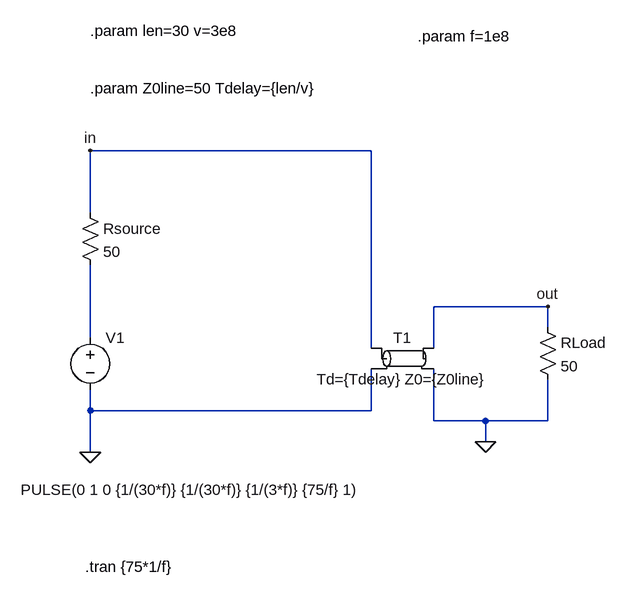
[diagram p0: schematic modelLinieFP_timp.asc]
modelLinieFP_timp.asc, the LTspice schematic file:
Version 4
SHEET 1 1040 1048
WIRE -352 320 -784 320
WIRE -784 416 -784 320
WIRE -80 560 -256 560
WIRE -80 592 -80 560
WIRE -784 608 -784 496
WIRE -352 624 -352 320
WIRE -256 624 -256 560
WIRE -784 720 -784 688
WIRE -352 720 -352 656
WIRE -352 720 -784 720
WIRE -256 736 -256 656
WIRE -176 736 -256 736
WIRE -80 736 -80 672
WIRE -80 736 -176 736
WIRE -176 768 -176 736
WIRE -784 784 -784 720
FLAG -784 784 0
FLAG -176 768 0
FLAG -80 560 out
FLAG -784 320 in
SYMBOL res -96 576 R0
SYMATTR InstName RLoad
SYMATTR Value 50
SYMBOL tline -304 640 R0
SYMATTR InstName T1
SYMATTR Value Td={Tdelay} Z0={Z0line}
SYMBOL voltage -784 592 R0
WINDOW 123 24 124 Left 2
WINDOW 39 24 44 Left 2
WINDOW 3 -107 250 Left 2
SYMATTR Value PULSE(0 1 0 {1/(30*f)} {1/(30*f)} {1/(3*f)} {75/f} 1)
SYMATTR InstName V1
SYMBOL res -800 400 R0
SYMATTR InstName Rsource
SYMATTR Value 50
TEXT -792 960 Left 2 !.tran {75*1/f}
TEXT -784 136 Left 2 !.param len=30 v=3e8
TEXT -784 224 Left 2 !.param Z0line=50 Tdelay={len/v}
TEXT -280 144 Left 2 !.param f=1e8

The netlist it stands for:
* modelLinieFP_timp.asc
RLoad out 0 50
T1 in 0 out 0 Td={Tdelay} Z0={Z0line}
V1 N001 0 PULSE(0 1 0 {1/(30*f)} {1/(30*f)} {1/(3*f)} {75/f} 1)
Rsource in N001 50
.tran {75*1/f}
.param len=30 v=3e8
.param Z0line=50 Tdelay={len/v}
.param f=1e8
.backanno
.end